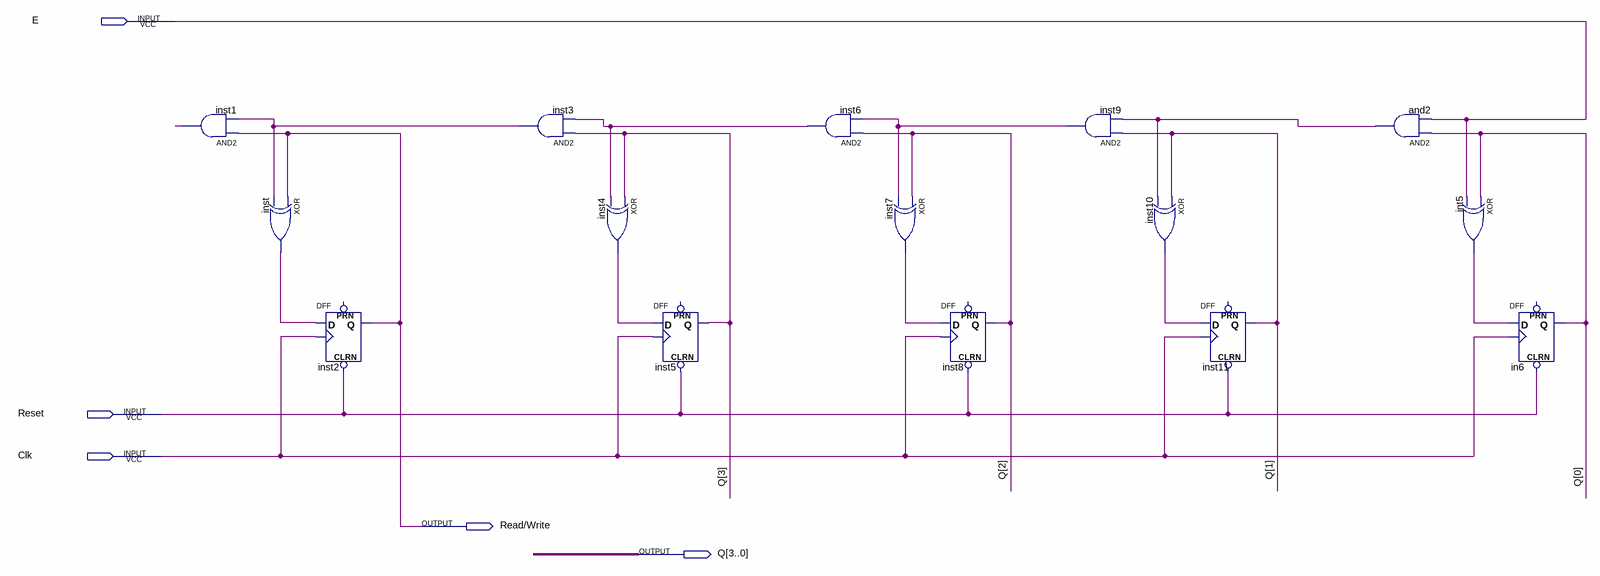
[diagram p0: schematic sheet]
// Quartus schematic 5bitupcounter.bdf as structural Verilog: 15 symbols, 5 pins
module \5bitupcounter  (
  input  E,
  input  Reset,
  input  Clk,
  output \Read/Write ,
  output [3:0] Q
);

  wire and2_out, inst1_out, inst3_out, inst4_out, inst6_out, inst7_out, inst9_out, inst10_out, inst_out,
       int5_out;

  and inst1 (inst1_out, \Read/Write , inst3_out);
  xor inst (inst_out, \Read/Write , inst3_out);
  DFF inst2 (.CLRN(Reset), .CLK(Clk), .D(inst_out), .Q(\Read/Write ));  // open: PRN
  and inst3 (inst3_out, Q[3], inst6_out);
  xor inst4 (inst4_out, Q[3], inst6_out);
  DFF inst5 (.CLRN(Reset), .CLK(Clk), .D(inst4_out), .Q(Q[3]));  // open: PRN
  and inst6 (inst6_out, Q[2], inst9_out);
  xor inst7 (inst7_out, Q[2], inst9_out);
  DFF inst8 (.CLRN(Reset), .CLK(Clk), .D(inst7_out), .Q(Q[2]));  // open: PRN
  and inst9 (inst9_out, Q[1], and2_out);
  xor inst10 (inst10_out, Q[1], and2_out);
  DFF inst11 (.CLRN(Reset), .CLK(Clk), .D(inst10_out), .Q(Q[1]));  // open: PRN
  and and2 (and2_out, Q[0], E);
  xor int5 (int5_out, Q[0], E);
  DFF in6 (.CLRN(Reset), .CLK(Clk), .D(int5_out), .Q(Q[0]));  // open: PRN
endmodule
